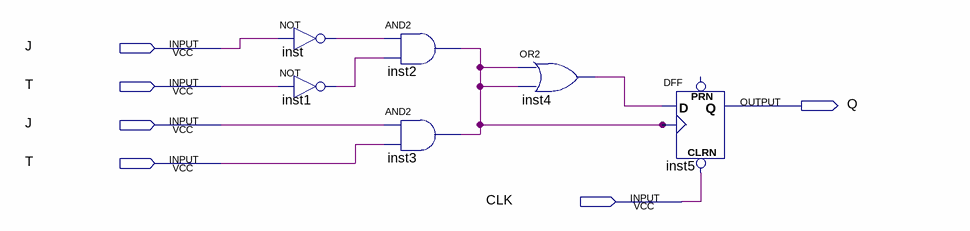
[diagram p0: schematic sheet]
// Quartus schematic design_LAB_6.bdf as structural Verilog: 6 symbols, 6 pins
module design_LAB_6 (
  input  J,
  input  T,
  input  CLK,
  output Q
);

  wire inst1_out, inst2_out, inst4_out, inst_out;

  not inst (inst_out, J);
  not inst1 (inst1_out, T);
  and inst2 (inst2_out, inst_out, inst1_out);
  and inst3 (inst2_out, J, T);
  or inst4 (inst4_out, inst2_out, inst2_out);
  DFF inst5 (.CLRN(CLK), .CLK(inst2_out), .D(inst4_out), .Q(Q));  // open: PRN
endmodule
